# EAGLE design ICM-20948-breakout (EAGLE 9.5.2)
REVISION: 1.0; SCH_DESC: Breakout board for the LSM9DS1; TEAM: RoboCup
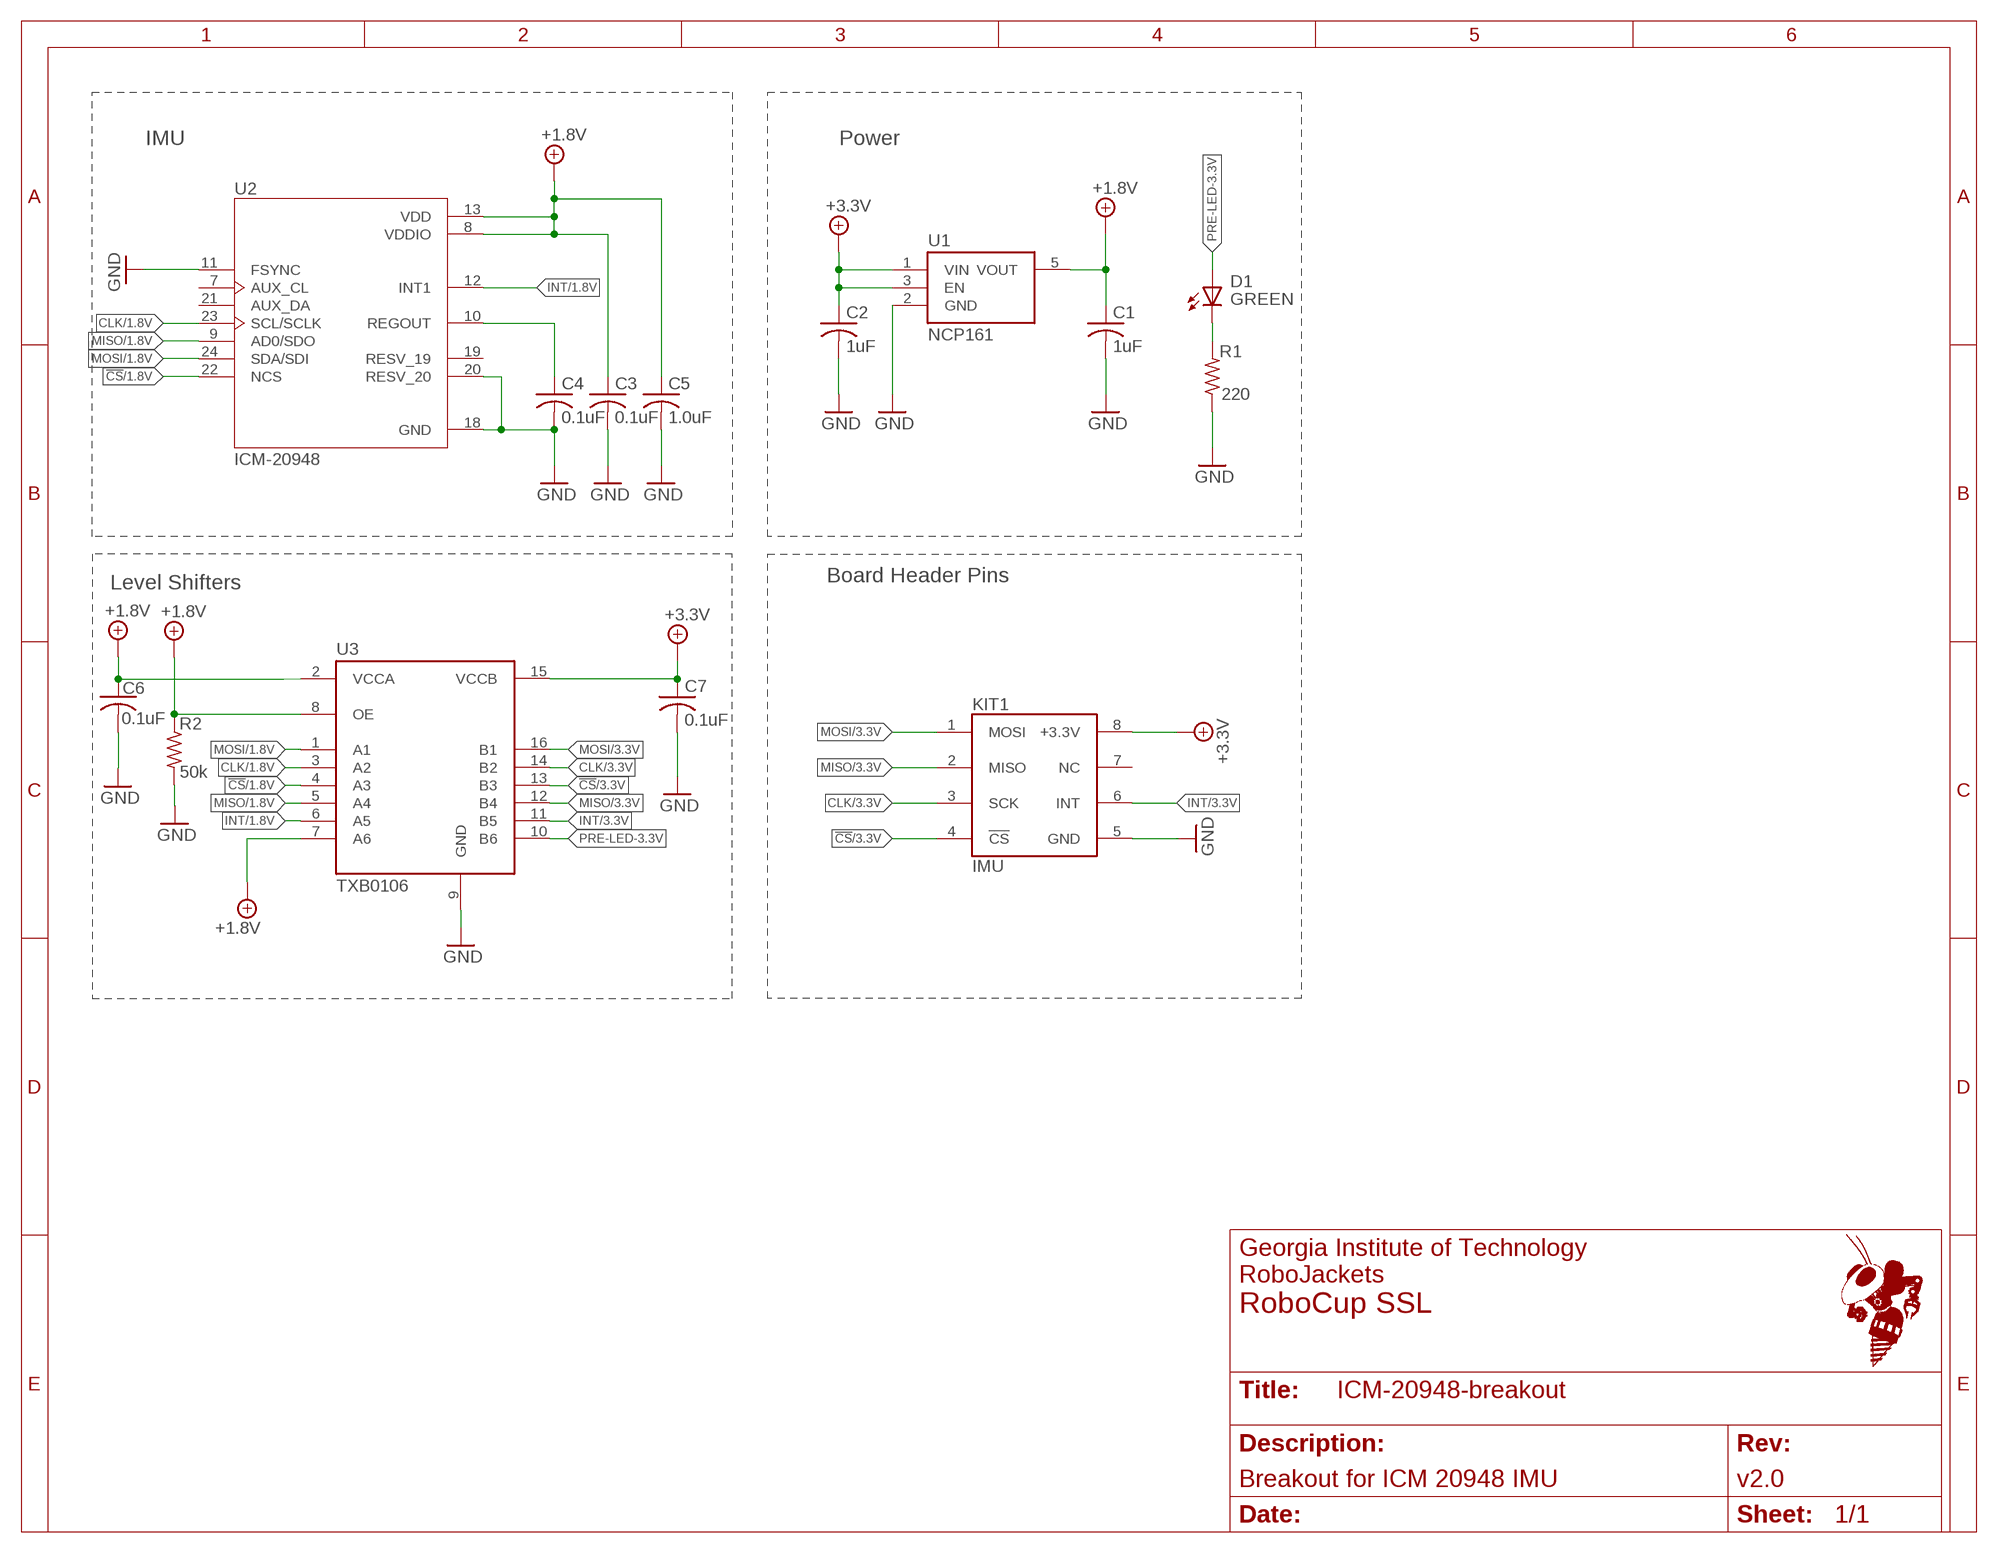
[diagram p0: schematic, sheet 1]
FRAME1 (FRAME_A_L): REVISION: v2.0; SCH_DESC: Breakout for ICM 20948 IMU; TEAM: RoboCup SSL

## Parts
C1  1uF  C-USC0603  [C0603]
C2  1uF  C-USC0603  [C0603]
C3  0.1uF  C-USC0603  [C0603]
C4  0.1uF  C-USC0603  [C0603]
C5  1.0uF  C-USC0603  [C0603]
C6  0.1uF  C-USC0603  [C0603]
C7  0.1uF  C-USC0603  [C0603]
D1  GREEN  LED-SMD-GREEN  [CHIP-LED0603]
KIT1  IMU  [IMU]
R1  220  R0603W  [R0603W]
R2  50k  R0603W  [R0603W]
U1  NCP161  [SOT-23-5]
U2  ICM-20948  ICM-20948ICM-20948  [ICM-20948]
U3  TXB0106  [TSSOP-16]

## Nets
!CS!/1.8V: U2.22(NCS) U3.4(A3)
!CS!/3.3V: KIT1.4(!CS!) U3.13(B3)
+1.8V: C1.1 C3.1 C5.1 C6.1 R2.1(PIN1) U1.5(VOUT) U2.8(VDDIO) U2.13(VDD) U3.2(VCCA) U3.7(A6) U3.8(OE)
+1.8V-D1-OUT: D1.C(K) R1.2(PIN2)
+3.3V: C2.1 C7.1 KIT1.8(+3.3V) U1.1(VIN) U1.3(EN) U3.15(VCCB)
CLK/1.8V: U2.23(SCL/SCLK) U3.3(A2)
CLK/3.3V: KIT1.3(SCK) U3.14(B2)
GND: C1.2 C2.2 C3.2 C4.2 C5.2 C6.2 C7.2 KIT1.5(GND) R1.1(PIN1) R2.2(PIN2) U1.2(GND) U2.11(FSYNC) U2.18(GND) U2.20(RESV_20) U3.9(GND)
INT/1.8V: U2.12(INT1) U3.6(A5)
INT/3.3V: KIT1.6(INT) U3.11(B5)
MISO/1.8V: U2.9(AD0/SDO) U3.5(A4)
MISO/3.3V: KIT1.2(MISO) U3.12(B4)
MOSI/1.8V: U2.24(SDA/SDI) U3.1(A1)
MOSI/3.3V: KIT1.1(MOSI) U3.16(B1)
PRE-LED-3.3V: D1.A U3.10(B6)
REGOUT: C4.1 U2.10(REGOUT)
Unconnected: KIT1.7(NC) U2.7(AUX_CL) U2.19(RESV_19) U2.21(AUX_DA)

## Notes on the sheet
- IMU | Power
- Board Header Pins
- Level Shifters

## Library data of the parts
C1-C7 = rcl:C-US: CAPACITOR, American symbol; SPICEPREFIX: C
D1 = RoboJackets-LEDs:LED-SMD; DIGIKEY: 160-1446-1-ND; MPN: LTST-C191KGKT
KIT1 = RoboJackets-Boards:IMU: IMU breakout board
R1 R2 = RoboJackets-Resistors:R0603W
U1 = RoboJackets-PowerICs:NCP161: NCP161 LDO linear regulator capable of supplying 450 mA output current for Vin less than or equal to +6V Vout = 1.8V / 2.5V / 3.3V / 5.14V Datasheet: https://www.onsemi.com/pub/Collateral/NCP161-D.PDF
U2 = RoboJackets-Sensors:ICM-20948: Axis=3 Axis Gyro+3 Axis Accel+Compass. Pin For Pin With m
U3 = TXB0106:TXB0106: TI TXB0106 6-Bit Bi-Directional Level Shifter (1.2V-3.6V to 1.65V-5.5V)

## Board
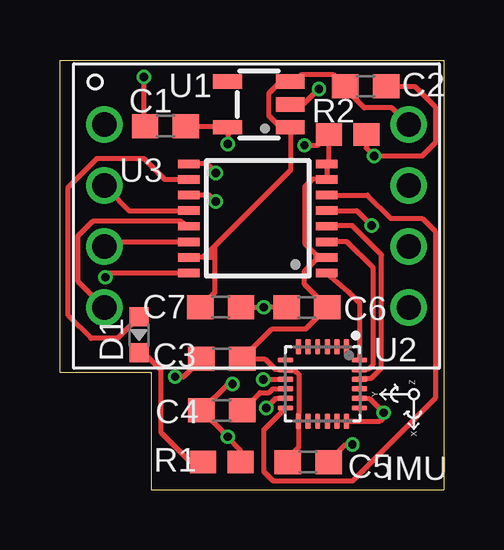
[diagram p1: board, top side]
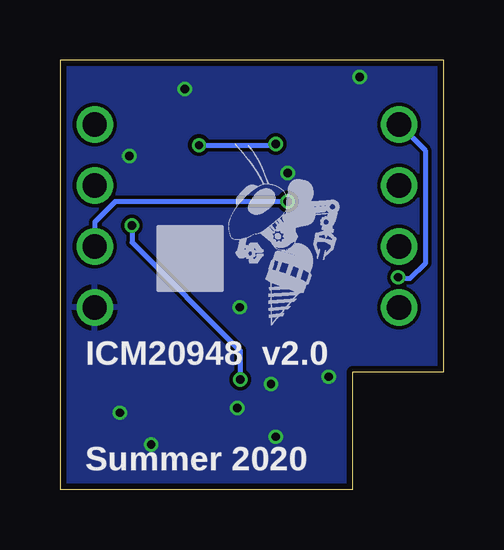
[diagram p2: board, bottom side, seen from below]

Size 16 x 17.9 mm. Coordinates in mm from the lower left corner, seen from the top.
Outline: 0,4.9 3.8,4.9 3.8,0 16,0 16,17.9 0,17.9 0,4.9
Copper layers (1*16): Top 0.018mm / dielectric 1.55mm / Bottom 0.018mm
Design rules "eC_2Layer_PClass6_BaseCopperO18_eCDefault": minimum track width 0.15mm, minimum drill 0.35mm, track to track 0.15mm, track to pad 0.15mm, pad to pad 0.15mm, via to via 0.15mm, smd to smd 0mil, copper to edge 0.25mm, drill to drill 0.35mm, minimum pad ring 0.175mm, minimum via ring 0.125mm, stop-mask expansion 0mil, vias tented up to drill 0.45mm, thermal gap 0.2mm

### Footprints (pad centres in the part's own frame; a part is rotated, then mirrored left to right if it is on the bottom)
C0603 = smd 1.1 x 1: 1 -0.85,0; 2 0.85,0
CHIP-LED0603 = smd 0.8 x 0.8: A 0,-0.75; C 0,0.75
IMU = drill 1.016: 1 -6.35,3.81; 2 -6.35,1.27; 3 -6.35,-1.27; 4 -6.35,-3.81; 5 6.35,-3.81; 6 6.35,-1.27; 7 6.35,1.27; 8 6.35,3.81
R0603W = smd 1.09 x 0.94: 1 -0.775,0; 2 0.775,0
SOT-23-5 = smd 0.6 x 1.2: 1 -0.95,-1.306; 2 0,-1.306; 3 0.95,-1.306; 4 0.95,1.306; 5 -0.95,1.306
ICM-20948 = smd 0.64 x 0.22: 1 -1.545,1; 2 -1.545,0.6; 3 -1.545,0.2; 4 -1.545,-0.2; 5 -1.545,-0.6; 6 -1.545,-1; 13 1.545,-1; 14 1.545,-0.6; 15 1.545,-0.2; 16 1.545,0.2; 17 1.545,0.6; 18 1.545,1 | smd 0.22 x 0.64: 7 -1,-1.545; 8 -0.6,-1.545; 9 -0.2,-1.545; 10 0.2,-1.545; 11 0.6,-1.545; 12 1,-1.545; 19 1,1.545; 20 0.6,1.545; 21 0.2,1.545; 22 -0.2,1.545; 23 -0.6,1.545; 24 -1,1.545
TSSOP-16 = smd 0.9 x 0.35: 1 -2.875,2.275; 2 -2.875,1.625; 3 -2.875,0.975; 4 -2.875,0.325; 5 -2.875,-0.325; 6 -2.875,-0.975; 7 -2.875,-1.625; 8 -2.875,-2.275; 9 2.875,-2.275; 10 2.875,-1.625; 11 2.875,-0.975; 12 2.875,-0.325; 13 2.875,0.325; 14 2.875,0.975; 15 2.875,1.625; 16 2.875,2.275

### Placement (x,y rotation side)
C1  4.4,15.15 180 top
C2  12.75,16.8 0 top
C3  6.75,5.45 180 top
C4  6.75,3.3 180 top
C5  10.35,1.15 0 top
C6  10.3,7.6 180 top
C7  6.7,7.6 0 top
D1  3.3,6.45 180 top
KIT1  8.2,11.4 0 top
R1  6.75,1.15 180 top
R2  12,14.8 0 top
U1  8.3,16.05 90 top
U2  10.95,4.4 270 top
U3  8.25,11.3 180 top
U$1  [ROBOBUZZ_0.4X]  7.2,6.85 0 bottom

### Tracks (layer width: path | path; a pad name or v marks a point on that pad's centre or on a via)
!CS!/1.8V
  Top 0.2: U2.22 12.54,4.64 13,4.64 13.41,5.06 13.41,9.79 12.2,11 11.27,11 U3.4
!CS!/3.3V
  Top 0.2: U3.13 5.05,11.18 1.37,11.18 0.75,10.56 0.75,8.69 KIT1.4
+1.8V  (via drill 0.35)
  Top 0.2: C5.1 9.5,1.3 9.95,1.76 U2.13 9.95,3.18 9.97,3.2 9.97,4.8 9.81,4.96 9.45,4.96 U2.8 9,5 8.55,5.45 C3.1 8.85,6.7 10.25,6.7 C6.1 10.2,8.55 10.2,9.1 10.65,9.55 | C1.1 6.99,15.15 U1.5 v7,14.4 | v10.2,14.35 10.77,14.35 R2.1 11.22,13.6 U3.8 U3.7 10.52,12.93 10.2,12.6 10.2,10.27 10.65,9.82 | 10.65,9.82 10.79,9.68 U3.2 10.77,9.68 10.65,9.55 | 10.65,9.82 10.65,9.55
  Bottom 0.2: v10.2,14.35 7.05,14.35 v7,14.4
+1.8V-D1-OUT
  Top 0.2: D1.C 3.5,5.7 4.2,5 4.2,2.4 5.45,1.15 R1.2
+3.3V
  Top 0.2: 6.45,10.15 9.61,13.31 U1.1 9.21,15.1 8.71,15.6 8.7,15.6 8.7,16.5 9.2,17 U1.3 9.8,17 10.1,17.3 11.4,17.3 C2.1 11.9,16.7 12.69,15.91 13.85,15.91 KIT1.8 | 5.97,9.68 U3.15 | 6.45,10.15 6.25,9.95 | 6.25,9.95 5.97,9.68 | 6.45,10.15 6.45,9.7 | 6.45,9.7 6.45,8.2 C7.1 | 5.97,9.68 6.2,9.68 | 6.2,9.68 6.42,9.68 6.45,9.7 | 6.2,9.68 6.25,9.72 6.25,9.95
CLK/1.8V
  Top 0.2: U2.23 12.54,5.04 12.9,5.04 13.06,5.2 13.06,7.4 13.06,9.23 11.97,10.33 U3.3
CLK/3.3V
  Top 0.2: KIT1.3 2.04,10.33 U3.14
GND  (via drill 0.35)
  Top 0.2: R1.1 7.52,1.65 7,2.18 v7,2.2 C4.2 7,4.4 v7.2,4.4 | U2.18 13.36,2.86 13.5,3 v13.5,3.2 12.9,3.8 U2.20 | v10.8,16.7 10.15,16.05 U1.2 | v3.5,17.2 3.5,15.2 C1.2 | v6.5,13.2 6.12,13.57 U3.9 | v12.2,1.88 11.93,1.88 C5.2 | C6.2 v8.5,7.6 C7.2 | R2.2 12.77,14.23 v13.1,13.9 15.1,13.9 15.65,14.45 15.65,15.95 14.8,16.8 C2.2 | v8.6,3.4 9,3.8 U2.11 | C3.2 5.15,4.7 v4.8,4.7
  pour Bottom: 0,4.9 3.8,4.9 3.8,0 16,0 16,17.9 0,17.9
INT/1.8V
  Top 0.2: U3.6 12.82,12.28 13.8,11.3 15.11,11.3 15.65,10.76 15.65,3.8 12.2,0.35 8.9,0.35 8.5,0.75 8.5,2.5 U2.12
INT/3.3V  (via drill 0.35)
  Top 0.2: v6.5,12 6.22,12.28 U3.11
  Bottom 0.2: KIT1.6 14.55,11.15 13.7,12 v6.5,12
MISO/1.8V  (via drill 0.35)
  Top 0.2: U3.5 12.38,11.62 v13,11 | v8.49,4.59 v8.5,4.6 U2.9
  Bottom 0.2: v13,11 13,10.3 8.49,5.79 v8.49,4.59
MISO/3.3V
  Top 0.2: KIT1.2 2.03,12.49 2.03,12.47 2.87,11.62 U3.12
MOSI/1.8V
  Top 0.2: U3.1 12.04,8.24 12.49,7.78 U2.24
MOSI/3.3V  (via drill 0.35)
  Top 0.2: U3.16 2.07,9.03 v1.9,8.85
  Bottom 0.2: v1.9,8.85 1.85,8.8 1.4,8.8 0.75,9.45 0.75,14.11 KIT1.1
PRE-LED-3.3V
  Top 0.2: D1.A 2.4,6.3 1.3,6.3 0.35,7.25 0.35,12.6 1.55,13.8 3.5,13.8 4.37,12.93 U3.10
REGOUT
  Top 0.2: C4.1 8.34,4.04 8.71,4.04 8.88,4.2 U2.10

### Text on the board
tPlace: IMU
bPlace: ICM20948 | Summer 2020